# EasyEDA Pro project ProProject_2023新生开发板（小组）_2025-05-30.epro, board PCB2
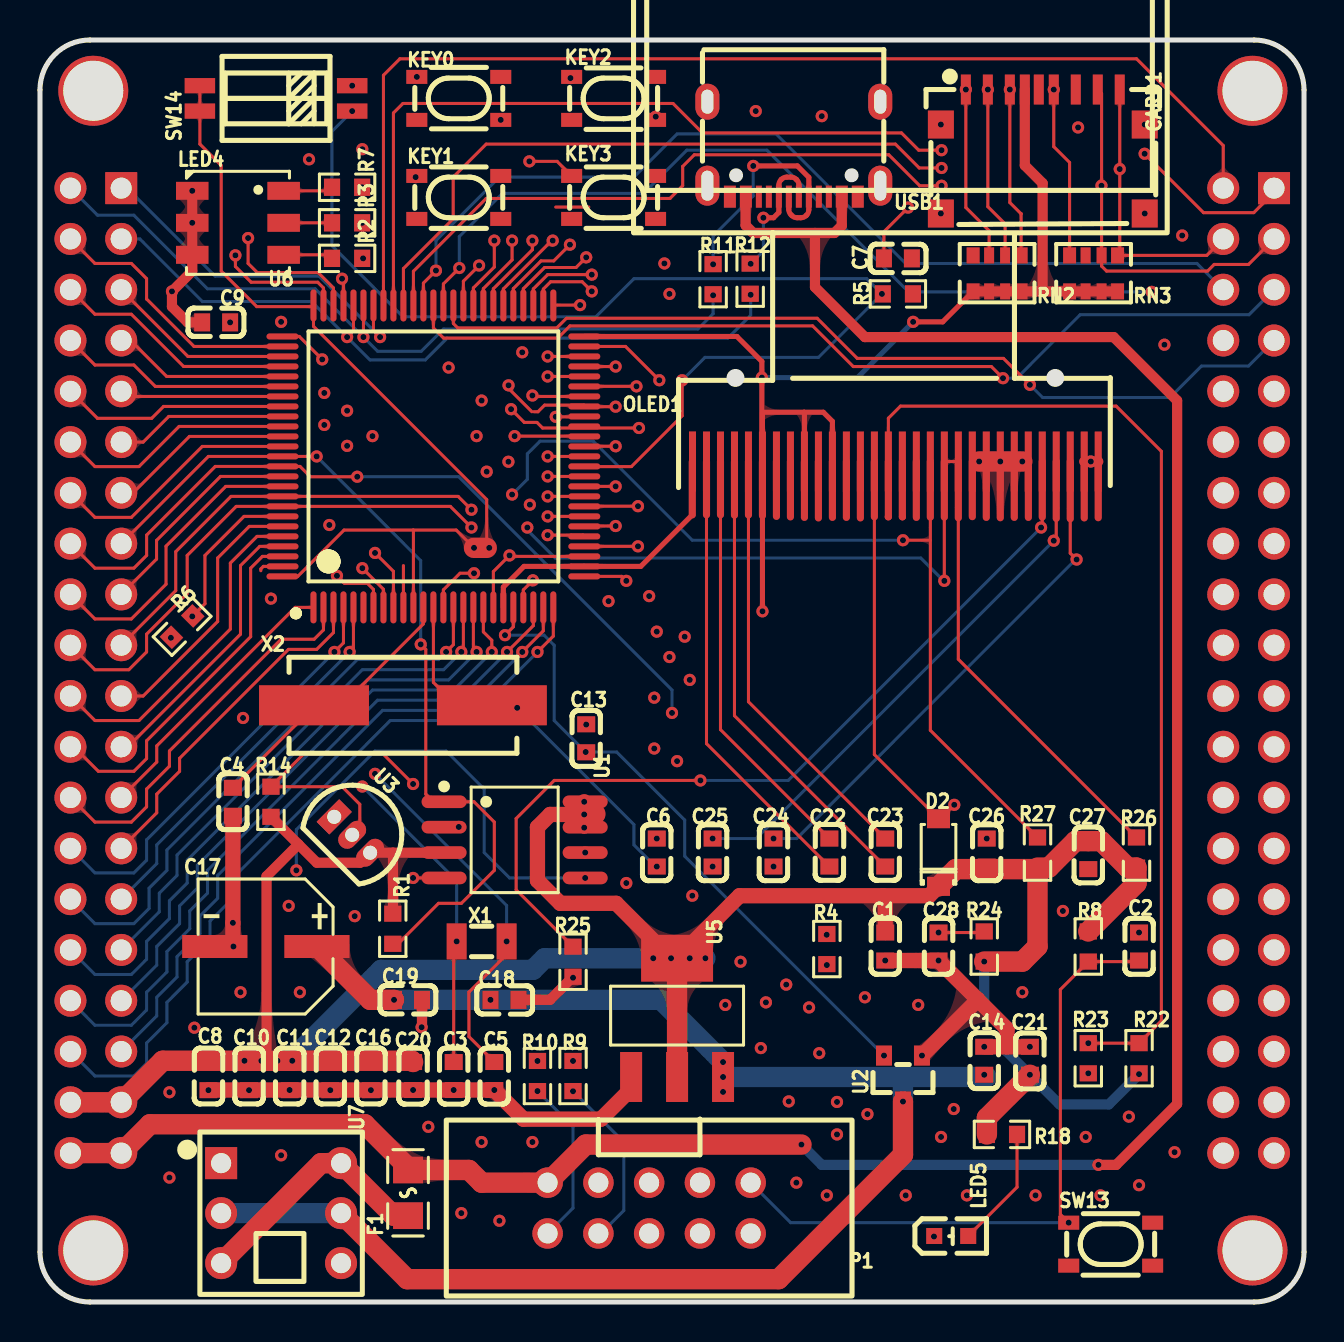
[diagram p4: board, top side]
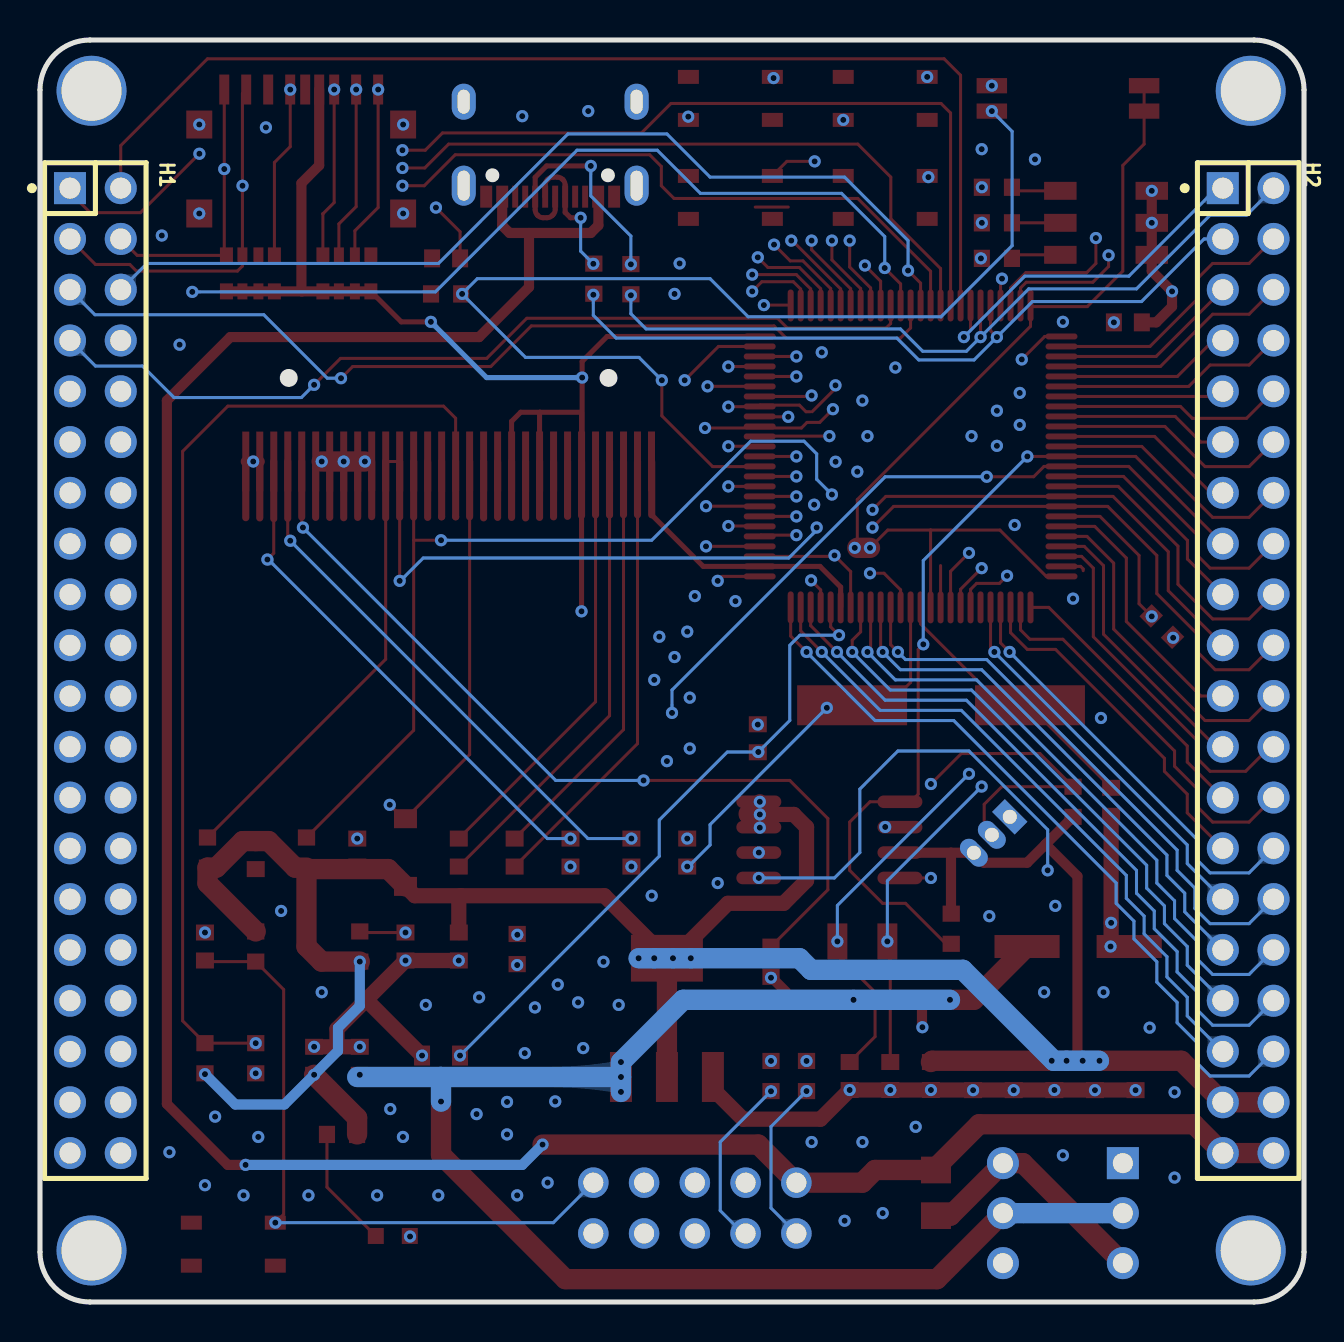
[diagram p5: board, bottom side, seen from below]

Outline 63.25 x 63.12 mm; copper layers: Top Layer, Inner1, Inner2, Bottom Layer. Coordinates in mm from the lower left corner of the outline.
Outline path: 0,60.62 0,2.5 arc(0.73,0.73) 2.5,0 60.75,0 arc(62.51,0.73) 63.25,2.5 63.25,60.62 arc(62.51,62.39) 60.75,63.12 2.5,63.12 arc(0.73,62.39) 0,60.62
Stack: Top Layer 0.035mm 外层铜厚1oz / Dielectric1 0.2104mm 7628 RC49% 8.6mil / Inner1 0.0152mm 内层铜厚 / Dielectric2 1.065mm 1.1mm H/HOZ 含铜 / Inner2 0.0152mm 内层铜厚 / Dielectric3 0.2104mm 7628 RC49% 8.6mil / Bottom Layer 0.035mm 外层铜厚1oz

## Design rules (mm)
template: JLCPCB Capability(Two Layers Board)
spacing copperThickness1oz (default): track to track 0.102, other pairs 0.152 to 0.3
spacing copperThickness2oz: track to track 0.203, other pairs 0.152 to 0.3
track width copperThickness1oz (default): min 0.127, default 0.254, max 2.54
track width copperThickness2oz: min 0.203, default 0.254, max 2.54
differential pair differentialPair (default): width min 0.127, default 0.254, max 2.54; gap min 0.152, default 0.152
via viaSize (default): diameter min 0.5, default 0.61, max 10; hole min 0.3, default 0.305, max 6.3

## Placement (name value [footprint] x y rotation side)
C1  100nF  [C0603]  42.29 17.78 270 top
C2  100nF  [C0603]  54.99 17.78 270 top
C3  12pF  [C0603]  20.7 11.3 90 top
C4  20pF  [C0603]  9.65 25.02 270 top
C5  12pF  [C0603]  22.73 11.3 90 top
C6  20pF  [C0603]  30.86 22.48 90 top
C7  1uF  [C0603]  42.93 52.2 180 top
C8  100nF  [C0603]  8.43 11.3 270 top
C9  1uF  [C0603]  8.81 49 0 top
C10  100nF  [C0603]  10.46 11.3 270 top
C11  100nF  [C0603]  12.49 11.3 270 top
C12  100nF  [C0603]  14.53 11.3 270 top
C13  100nF  [C0603]  27.33 28.19 90 top
C14  1uF  [C0603]  47.24 12.06 270 top
C16  100nF  [C0603]  16.56 11.3 270 top
C17  220uF  [CAP-SMD_BD6.3-L6.6-W6.6-LS7.2-R-RD]  11.3 17.78 0 top
C18  1uF  [C0603]  23.24 15.11 180 top
C19  100nF  [C0603]  18.41 15.11 0 top
C20  1uF  [C0603]  18.67 11.3 90 top
C21  100nF  [C0603]  49.53 12.06 90 top
C22  1uF  [C0603]  39.5 22.48 270 top
C23  1uF  [C0603]  42.29 22.48 270 top
C24  2.2uF  [C0603]  36.7 22.48 90 top
C25  4.7uF  [C0603]  33.66 22.48 90 top
C26  1uF  [C0603]  47.37 22.48 90 top
C27  1uF  [C0603]  52.45 22.35 270 top
C28  4.7uF  [C0603]  44.96 17.78 270 top
CARD1  XKTF-0803-0  [TF-SMD_XKTF-0803-0]  50.18 57.54 180 top
D2  1N4148W  [SOD-123_L2.8-W1.8-LS3.7-RD]  44.96 22.48 90 top
F1  BSMD0805-020-30V  [F0805]  18.41 5.46 90 top
H1  X6521WV-2x20H-C60D30  [HDR-TH_40P-2.54-V-M-R2-C20-S2.54]  60.47 31.58 270 bottom
H2  X6521WV-2x20H-C60D30  [HDR-TH_40P-2.54-V-M-R2-C20-S2.54]  2.79 31.58 270 bottom
KEY0  SKRPACE010  [KEY-SMD_4P-L4.2-W3.2-P2.20-LS4.6]  20.96 60.2 180 top
KEY1  SKRPACE010  [KEY-SMD_4P-L4.2-W3.2-P2.20-LS4.6]  20.96 55.25 0 top
KEY2  SKRPACE010  [KEY-SMD_4P-L4.2-W3.2-P2.20-LS4.6]  28.7 60.2 0 top
KEY3  SKRPACE010  [KEY-SMD_4P-L4.2-W3.2-P2.20-LS4.6]  28.7 55.25 0 top
LED4  MHP5050RGBDT  [LED-ARRAY-SMD_6P-L5.0-W5.0-TR-RD]  9.91 53.98 0 top
LED5  NCD0603R3  [LED0603-R-RD_RED]  45.59 3.3 0 top
NOREF  -  [Pad_e166]  2.67 2.58 0 top
NOREF#2  -  [Pad_e168]  60.67 2.58 0 top
NOREF#3  -  [Pad_e167]  60.67 60.58 0 top
NOREF#4  -  [Pad_e164]  2.67 60.58 0 top
OLED1  N096-2864KSWEG01-H30  [OLED_0.96-30P-P0.70-12864]  42.8 42.04 0 top
P1  2.54-2*5P简牛  [IDC-TH_10P-P2.54_C5665]  30.48 4.7 180 top
R1  10kΩ  [R0603]  17.65 18.67 270 top
R2  220Ω  [R0603]  15.37 52.2 180 top
R3  220Ω  [R0603]  15.37 53.98 180 top
R4  20Ω  [R0603]  39.37 17.65 90 top
R5  10kΩ  [R0603]  42.93 50.42 0 top
R6  10kΩ  [R0603]  7.11 33.78 225 top
R7  470Ω  [R0603]  15.37 55.75 180 top
R8  10kΩ  [R0603]  52.45 17.78 270 top
R9  20Ω  [R0603]  26.67 11.3 90 top
R10  20Ω  [R0603]  24.89 11.3 270 top
R11  20Ω  [R0603]  33.68 51.16 90 top
R12  20Ω  [R0603]  35.53 51.18 90 top
R14  10K  [R0603]  11.56 25.02 270 top
R18  470Ω  [R0603]  48.13 8.38 0 top
R22  4.7K  [R0603]  54.99 12.19 270 top
R23  4.7K  [R0603]  52.45 12.19 90 top
R24  4.7K  [R0603]  47.24 17.78 270 top
R25  910K  [R0603]  26.67 17.02 90 top
R26  4.7K  [R0603]  54.86 22.48 90 top
R27  4.7K  [R0603]  49.91 22.48 90 top
RN2  10kΩ  [RES-ARRAY-SMD_0603-8P-L3.2-W1.6-BL]  47.89 51.45 0 top
RN3  10kΩ  [RES-ARRAY-SMD_0603-8P-L3.2-W1.6-BL]  52.72 51.45 0 top
SW13  SKRPACE010  [KEY-SMD_4P-L4.2-W3.2-P2.20-LS4.6]  53.57 2.89 0 top
SW14  DSHP02TSGET  [SW-SMD_4P_DSHP02TSGET]  11.81 60.2 90 top
U1  W25Q16JVSSIQ  [SOIC-8_L5.3-W5.3-P1.27-LS8.0-BL]  23.75 23.11 270 top
U2  PJ75AL33SA  [SOT-23_L2.9-W1.3-P1.90-LS2.4-BR]  43.18 11.18 90 top
U3  DS18B20  [TO-92-3_L4.9-W3.7-P1.27-L]  15.62 23.37 315 top
U5  AMS1117-3.3  [SOT-223-3_L6.5-W3.4-P2.30-LS7.0-BR]  31.88 14.22 270 top
U6  STM32F407VET6  [LQFP-100_L14.0-W14.0-P0.50-LS16.0-BL]  19.69 42.29 0 top
U7  PB-22E08  [SW-TH_6P-L8.0-W8.0-P2.50_PB-22E08]  12.06 4.45 270 top
USB1  TYPE-C 16PIN 2MD(073)  [USB-C-SMD_TYPE-C-6PIN-2MD-073]  37.72 57.66 180 top
X1  32.768kHz  [FC-135R_L3.2-W1.5]  22.1 18.03 180 top
X2  8MHz  [CRYSTAL-SMD_L11.5-W4.8-LS12.7]  18.16 29.85 0 top

## Footprints (pads in the part's own frame, mm; a bottom-side part is the same pattern mirrored in y, then rotated)
C0603
  rect 0.8x0.9 smd: 1(-0.7,0) 2(0.7,0)
CAP-SMD_BD6.3-L6.6-W6.6-LS7.2-R-RD
  rect 3.26x1.15 smd: 1(2.555,0) 2(-2.555,0)
CRYSTAL-SMD_L11.5-W4.8-LS12.7
  rect 5.5x2 smd: 1(-4.45,0) 2(4.45,0)
F0805
  rect 1.335x1.5 smd: 1(-1.143,0) 2(1.143,0)
FC-135R_L3.2-W1.5
  rect 1x1.8 smd: 1(-1.25,0) 2(1.25,0)
HDR-TH_40P-2.54-V-M-R2-C20-S2.54
  rect 1.6x1.6 hole 1.05: 1(-24.13,-1.27)
  round 1.6 hole 1.05: 2(-24.13,1.27) 3(-21.59,-1.27) 4(-21.59,1.27) 5(-19.05,-1.27) 6(-19.05,1.27) 7(-16.51,-1.27) 8(-16.51,1.27) 9(-13.97,-1.27) 10(-13.97,1.27) 11(-11.43,-1.27) 12(-11.43,1.27) 13(-8.89,-1.27) 14(-8.89,1.27) 15(-6.35,-1.27) 16(-6.35,1.27) 17(-3.81,-1.27) 18(-3.81,1.27) 19(-1.27,-1.27) 20(-1.27,1.27) 21(1.27,-1.27) 22(1.27,1.27) 23(3.81,-1.27) 24(3.81,1.27) 25(6.35,-1.27) 26(6.35,1.27) 27(8.89,-1.27) 28(8.89,1.27) 29(11.43,-1.27) 30(11.43,1.27) 31(13.97,-1.27) 32(13.97,1.27) 33(16.51,-1.27) 34(16.51,1.27) 35(19.05,-1.27) 36(19.05,1.27) 37(21.59,-1.27) 38(21.59,1.27) 39(24.13,-1.27) 40(24.13,1.27)
IDC-TH_10P-P2.54_C5665
  round 1.524 hole 1: 1(-5.08,-1.27) 2(-5.08,1.27) 3(-2.54,-1.27) 4(-2.54,1.27) 5(0,-1.27) 6(0,1.27) 7(2.54,-1.27) 8(2.54,1.27) 9(5.08,-1.27) 10(5.08,1.27)
KEY-SMD_4P-L4.2-W3.2-P2.20-LS4.6
  rect 1.05x0.7 smd: 1(-2.1,1.075) 2(2.1,1.075) 3(-2.1,-1.075) 4(2.1,-1.075)
LED0603-R-RD_RED
  rect 0.8x0.8 smd: 1(0.851,0) 2(-0.851,0)
LED-ARRAY-SMD_6P-L5.0-W5.0-TR-RD
  rect 1.625x0.896 smd: 1(2.288,1.6) 2(-2.288,1.6) 3(2.288,0) 4(-2.288,0) 5(2.288,-1.6) 6(-2.288,-1.6)
LQFP-100_L14.0-W14.0-P0.50-LS16.0-BL
  oval 0.3x1.6 smd: 1(-6,-7.55) 2(-5.5,-7.55) 3(-5,-7.55) 4(-4.5,-7.55) 5(-4,-7.55) 6(-3.5,-7.55) 7(-3,-7.55) 8(-2.5,-7.55) 9(-2,-7.55) 10(-1.5,-7.55) 11(-1,-7.55) 12(-0.5,-7.55) 13(0,-7.55) 14(0.5,-7.55) 15(1,-7.55) 16(1.5,-7.55) 17(2,-7.55) 18(2.5,-7.55) 19(3,-7.55) 20(3.5,-7.55) 21(4,-7.55) 22(4.5,-7.55) 23(5,-7.55) 24(5.5,-7.55) 25(6,-7.55) 51(6,7.55) 52(5.5,7.55) 53(5,7.55) 54(4.5,7.55) 55(4,7.55) 56(3.5,7.55) 57(3,7.55) 58(2.5,7.55) 59(2,7.55) 60(1.5,7.55) 61(1,7.55) 62(0.5,7.55) 63(0,7.55) 64(-0.5,7.55) 65(-1,7.55) 66(-1.5,7.55) 67(-2,7.55) 68(-2.5,7.55) 69(-3,7.55) 70(-3.5,7.55) 71(-4,7.55) 72(-4.5,7.55) 73(-5,7.55) 74(-5.5,7.55) 75(-6,7.55)
  oval 1.6x0.3 smd: 26(7.55,-6) 27(7.55,-5.5) 28(7.55,-5) 29(7.55,-4.5) 30(7.55,-4) 31(7.55,-3.5) 32(7.55,-3) 33(7.55,-2.5) 34(7.55,-2) 35(7.55,-1.5) 36(7.55,-1) 37(7.55,-0.5) 38(7.55,0) 39(7.55,0.5) 40(7.55,1) 41(7.55,1.5) 42(7.55,2) 43(7.55,2.5) 44(7.55,3) 45(7.55,3.5) 46(7.55,4) 47(7.55,4.5) 48(7.55,5) 49(7.55,5.5) 50(7.55,6) 76(-7.55,6) 77(-7.55,5.5) 78(-7.55,5) 79(-7.55,4.5) 80(-7.55,4) 81(-7.55,3.5) 82(-7.55,3) 83(-7.55,2.5) 84(-7.55,2) 85(-7.55,1.5) 86(-7.55,1) 87(-7.55,0.5) 88(-7.55,0) 89(-7.55,-0.5) 90(-7.55,-1) 91(-7.55,-1.5) 92(-7.55,-2) 93(-7.55,-2.5) 94(-7.55,-3) 95(-7.55,-3.5) 96(-7.55,-4) 97(-7.55,-4.5) 98(-7.55,-5) 99(-7.55,-5.5) 100(-7.55,-6)
OLED_0.96-30P-P0.70-12864
  rect 0.35x3 smd: 1(-10.15,0.003) 2(-9.45,0.001) 3(-8.75,0.001) 4(-8.05,0.001) 5(-7.35,0.001) 6(-6.65,0.001) 7(-5.95,0.001) 8(-5.25,0.001) 9(-4.55,0.001) 10(-3.85,0.001) 11(-3.15,0.001) 12(-2.45,0.001) 13(-1.75,0.001) 14(-1.05,0.001) 15(-0.35,0.001) 16(0.35,0.001) 17(1.05,0.001) 18(1.75,0.001) 19(2.45,0.001) 20(3.15,0.001) 21(3.85,0.001) 22(4.55,0.001) 23(5.25,0.001) 24(5.95,0.001) 25(6.65,0.001) 26(7.35,0.001) 27(8.05,0.001) 28(8.75,-0.002) 29(9.45,-0.003) 30(10.15,-0.003)
Pad_e164
  round 3.5 hole 3: NC(0,0)
Pad_e166
  round 3.5 hole 3: NC(0,0)
Pad_e167
  round 3.5 hole 3: NC(0,0)
Pad_e168
  round 3.5 hole 3: NC(0,0)
R0603
  rect 0.806x0.864 smd: 1(-0.753,0) 2(0.753,0)
RES-ARRAY-SMD_0603-8P-L3.2-W1.6-BL
  rect 0.65x0.8 smd: 1(-1.2,-0.9) 4(1.2,-0.9) 5(1.2,0.9) 8(-1.2,0.9)
  rect 0.5x0.8 smd: 2(-0.4,-0.9) 3(0.4,-0.9) 6(0.4,0.9) 7(-0.4,0.9)
SOD-123_L2.8-W1.8-LS3.7-RD
  rect 0.95x1.15 smd: 1(-1.692,0) 2(1.692,0)
SOIC-8_L5.3-W5.3-P1.27-LS8.0-BL
  oval 0.63x2.25 smd: 1(-1.905,-3.53) 2(-0.635,-3.53) 3(0.635,-3.53) 4(1.905,-3.53) 5(1.905,3.53) 6(0.635,3.53) 7(-0.635,3.53) 8(-1.905,3.53)
SOT-23_L2.9-W1.3-P1.90-LS2.4-BR
  rect 1x0.8 smd: 1(1.15,-0.95) 2(1.15,0.95) 3(-1.15,0)
SOT-223-3_L6.5-W3.4-P2.30-LS7.0-BR
  rect 2.5x1.1 smd: 1(2.97,-2.3) 2(2.97,0) 3(2.97,2.3)
  rect 2.34x3.6 smd: 4(-2.97,0)
SW-SMD_4P_DSHP02TSGET
  rect 0.762x1.524 smd: 1(-0.635,-3.81) 2(0.635,-3.81) 3(0.635,3.81) 4(-0.635,3.81)
SW-TH_6P-L8.0-W8.0-P2.50_PB-22E08
  rect 1.6x1.6 hole 1: 1(-2.5,-3)
  round 1.6 hole 1: 2(0,-3) 3(2.5,-3) 4(-2.5,3) 5(0,3) 6(2.5,3)
TF-SMD_XKTF-0803-0
  rect 0.5x1.5 smd: 1(3.85,-3.1) 2(2.75,-3.1) 3(1.65,-3.1) 4(0.9,-3.1) 5(-0.55,-3.1) 6(-1.65,-3.1) 7(-2.75,-3.1) 8(-3.85,-3.1) 9(0.2,-3.1)
  rect 1.3x1.4 smd: 10(-5.1,-1.35) 11(-5.1,3.1) 12(5.1,3.1) 13(5.1,-1.35)
TO-92-3_L4.9-W3.7-P1.27-L
  rect 0.9x1.6 hole 0.7: 1(-1.27,0)
  oval 0.9x1.6 hole 0.7: 2(0,0) 3(1.27,0)
USB-C-SMD_TYPE-C-6PIN-2MD-073
  rect 0.6x1.1 smd: 1(-3.2,2.375) 2(-2.4,2.375) 11(2.4,2.375) 12(3.2,2.375)
  rect 0.3x1.1 smd: 3(-1.75,2.375) 4(-1.25,2.375) 5(-0.75,2.375) 6(-0.25,2.375) 7(0.25,2.375) 8(0.75,2.375) 9(1.25,2.375) 10(1.75,2.375)
  oval 1.2x2 hole 0.6x1.5: 13(-4.325,1.825) 14(4.325,1.825)
  oval 1.2x1.8 hole 0.6x1.2: 13(-4.325,-2.375) 14(4.325,-2.375)

## Nets
As in the schematic, except:
GND: C1.2 C2.1 C3.1 C4.2 C5.1 C6.2 C7.1 C8.2 C9.1 C10.2 C11.2 C12.2 C13.2 C14.1 C16.2 C17.2 C18.1 C19.2 C20.1 C21.2 C24.1 C25.1 C26.2 C27.2 C28.2 CARD1.6 CARD1.10 CARD1.11 CARD1.12 CARD1.13 H1.39 H1.40 KEY0.4 KEY1.4 KEY2.4 KEY3.4 LED4.2 LED4.4 LED4.6 LED5.2 OLED1.1 OLED1.8 OLED1.10 OLED1.12 OLED1.13 OLED1.16 OLED1.17 OLED1.21 OLED1.22 OLED1.23 OLED1.24 OLED1.25 OLED1.29 OLED1.30 P1.5 P1.6 R5.2 R6.2 R23.1 R25.1 SW13.4 U1.4 U2.1 U3.1 U5.1 U6.10 U6.20 U6.27 U6.74 U6.99 USB1.1 USB1.12 USB1.13 USB1.14
KEY0: H2.30 KEY0.1 U6.15
KEY1: H2.31 KEY1.1 U6.16
KEY2: H2.32 KEY2.1 U6.17
KEY3: H2.33 KEY3.1 U6.18

Pads without a net: CARD1 9; KEY0 2 3; KEY1 2 3; KEY2 2 3; KEY3 2 3; NOREF NC; NOREF#2 NC; NOREF#3 NC; NOREF#4 NC; OLED1 7; P1 3 7; RN2 8; RN3 7; SW13 2 3; U7 1 6; USB1 3 4 9 10

## Via types
v1: diameter 0.61, hole 0.305, Top Layer to Bottom Layer, 274 vias

## Routing (per net, layer and track width the routed paths; a pad name or vN(x,y) marks a point on that pad's centre or on a via; arc(x,y) is an arc through that point)
3V3: length 294.5
  Top Layer w0.152: v1(24.66,36.09) 24.19,35.62 U6.22 ; U6.100 12.9,36.29 15.21,38.61 18.67,38.61 18.69,38.58 ; v1(23.49,37.34) 23.54,37.29 U6.28 ; 22.35,37.9 22.35,40.13 13.69,48.8 U6.75 13.63,49.78 10.85,49.78 9.07,51.56 9.07,56.85 8,57.91 SW14.4 SW14.3 ; 18.69,38.58 18.69,38.57 U6.11 ; 18.69,38.58 18.69,38.61 20.83,38.61 v1(21.72,37.72) ; 23.36,37.21 22.69,36.53 U6.19
  Top Layer w0.254: 38.24,44.5 38.25,44.49 OLED1.9 ; 38.24,44.5 39.19,44.5 39.65,44.04 39.65,42.04 ; 38.24,44.5 36.15,44.5 OLED1.6 36.12,42.07 v1(36.12,46.23) 36.12,47.04 34.87,48.29 U6.50 ; 36.15,39.33 v1(36.15,34.54) ; RN2.1 45.17,49.02 v1(43.69,49.02)
  Top Layer w0.355: OLED1.6 36.15,39.33 ; OLED1.9 38.25,39.24 ; 39.65,42.04 39.65,39.24
  Top Layer w0.508: 12.93,22.89 11.34,21.3 11.34,12.06 ; 12.93,22.89 R14.2 ; 12.93,22.89 13.85,21.97 16.02,21.97 16.52,22.47 17.66,22.47 ; 17.66,22.47 17.66,19.43 R1.1 ; 17.66,22.47 19.29,22.47 19.3,22.48 U1.3 ; 50.14,50.55 50.16,50.57 50.16,55.96 49.28,56.85 CARD1.4 ; 50.14,50.55 RN3.2 RN3.3 RN3.4 ; 50.14,50.55 RN2.4 RN2.3 RN2.2 RN2.1
  Top Layer w0.762: C1.1 42.29,20.22 42.19,20.32 ; v1(27.23,25.02) v1(27.23,24.38) 25.53,24.38 24.89,23.75 24.89,21.08 26.03,19.94 28.83,19.94 v1(31.57,17.19) U5.4 35,20.32 42.19,20.32 ; D2.1 44.49,20.32 42.19,20.32
  Top Layer w1.016: 27.79,24.41 27.76,24.38 v1(27.23,24.38) ; C20.2 18.61,12.06 v1(12.62,12.06) v1(11.88,12.06) v1(10.23,12.06) 6.14,12.06 H2.37 H2.38 ; D2.1 45.82,21.65 49.91,21.65 49.91,17.78 49.16,17.03 v1(47.24,17.03) ; v1(49.53,11.37) 47.38,9.21 R18.1 ; R27.1 50.48,21.73 51.81,23.05 C27.1 53.1,23.05 54.42,21.73 R26.1 54.86,20.95 R8.1 ; 31.88,11.25 U5.4 ; 22.35,37.72 v1(21.72,37.72)
  Inner1 w0.254: v1(36.15,34.54) 30.27,34.54 28.28,32.55
  Inner1 w1.016: v1(27.23,23.72) v1(27.23,24.38) 27.23,25.2 29.46,27.43 29.46,31.37 v1(23.49,37.34) 23.11,37.72 v1(22.48,37.72) v1(21.72,37.72)
  Bottom Layer w0.254: v1(36.12,46.23) 40.9,46.23 v1(43.69,49.02)
  Bottom Layer w0.508: v1(47.24,17.03) 47.24,14.81 48.34,13.72 48.34,12.56 v1(49.53,11.37) 51.01,9.88 53.47,9.88 v1(54.99,11.4)
  Bottom Layer w1.016: v1(33.29,17.19) v1(32.51,17.19) v1(31.57,17.19) v1(30.68,17.19) 25.25,17.19 24.66,16.61 17.07,16.61 12.52,12.06 v1(11.88,12.06) v1(11.08,12.06) 10.26,12.06
+5V: length 79.4
  Top Layer w1.016: C17.1 16.53,15.11 v1(17.72,15.11) ; v1(43.18,10.03) 43.18,7.37 36.96,1.14 18.37,1.14 U7.5
  Bottom Layer w1.016: v1(17.72,15.11) v1(22.54,15.11) 31.06,15.11 v1(34.18,12) v1(34.18,11.25) ; v1(34.18,11.25) 43.19,11.25 ; v1(34.18,11.25) v1(34.18,10.51) ; 43.19,11.25 47.37,11.25 ; 43.19,11.25 43.18,11.24 v1(43.18,10.03) ; U7.2 U7.5
  vias: v1(47.24,11.37)
GND: length 128
  Top Layer w0.152: U1.4 v1(18.67,21.21) ; U6.74 14.19,50.72 13.9,51 10.57,51 9.78,51.79 v1(9.78,52.35) ; 11.05,36.58 11.05,36.66 11.18,36.79 U6.99 ; U6.10 18.19,36.83 ; 25.81,54.76 27.46,54.76
  Top Layer w0.254: U6.20 23.19,35.76 24.22,36.79 U6.27 30.06,36.79 32.64,39.37 ; 32.64,42.03 OLED1.1
  Top Layer w0.355: v1(48.05,42.04) 48.05,39.23 ; 32.64,42.03 32.64,39.37 ; OLED1.22 47.35,39.24 ; v1(49.15,42.04) 49.45,41.73 49.45,39.24 ; OLED1.21 46.65,39.28 ; OLED1.8 37.55,39.27 ; OLED1.29 52.25,39.22 ; OLED1.17 43.85,39.24 ; OLED1.24 48.75,39.24 ; 43.15,39.27 43.15,39.27 OLED1.16 ; OLED1.10 38.95,39.22 ; OLED1.13 41.05,39.22 ; OLED1.30 52.95,39.23 ; OLED1.12 40.35,39.24
  Top Layer w0.508: v1(19.1,13.74) 19.12,13.76 C19.2 ; R25.1 25.52,15.11 C18.1 ; OLED1.29 OLED1.30 ; v1(7.62,55.58) v1(7.62,53.98) LED4.6 7.62,51.56 v1(6.6,50.55) 6.6,49.78 7.39,49 C9.1
  Top Layer w0.762: v1(47.24,12.77) 48.39,12.77 ; 48.39,12.77 48.39,13.65 46.9,15.13 ; 48.39,12.77 v1(49.53,12.77) ; 46.9,15.13 v1(44.96,17.08) v1(42.29,17.08) ; 46.9,15.13 46.9,15.1 v1(44.13,12.33) ; v1(8.43,10.6) 8.44,10.6 v1(12.49,10.6) v1(18.67,10.6) v1(20.7,10.6) v1(22.73,10.6) 24.19,9.14 28.07,9.14 29.58,10.65 29.58,11.25 ; C17.2 9.65,17.78 v1(9.65,18.97) C4.2
  Top Layer w1.016: v1(46.99,42.04) OLED1.22 v1(48.05,42.04) OLED1.24 v1(49.15,42.04)
  Inner2 w1.524: 32.51,59.77 33.13,59.77 USB1.14 34.63,60.03 34.7,60.1 ; 32.23,55.8 32.26,55.83 USB1.14
  vias: v1(6.48,10.49) v1(6.48,6.22) v1(6.55,33.22) v1(7.73,13.72) v1(9.68,17.78) v1(10.03,15.49) v1(10.16,29.21) v1(10.46,10.6) v1(11.56,35.18) v1(12.06,49.02) v1(12.06,7.34) v1(12.45,19.81) v1(13,15.49) v1(13.46,57.15) v1(14.22,45.47) v1(14.22,43.87) v1(14.48,38.86) v1(14.53,10.6) v1(15.37,44.58) v1(15.37,42.82) v1(15.75,19.3) v1(16.13,57.66) v1(16.56,10.6) v1(16.64,43.31) v1(18.85,61.27) v1(19.43,8.76) v1(20.45,46.74) v1(21.08,4.45) v1(21.84,43.31) v1(22.1,45.09) v1(22.09,8) v1(22.35,41.53) v1(22.99,4.06) v1(23.44,42.03) v1(24.13,47.5) v1(24.51,39.88) v1(24.64,8) v1(26.67,16.22) v1(27.33,28.88) v1(28.45,35.05) v1(29.34,20.96) v1(30.48,35.31) v1(30.81,59.28) v1(30.73,30.23) v1(30.73,27.68) v1(30.86,33.53) v1(30.86,23.18) v1(31.24,51.94) v1(31.5,50.42) v1(31.5,32.26) v1(31.88,27.05) v1(32.26,33.27) v1(32.51,31.12) v1(32.64,20.32) v1(33.66,21.78) v1(34.29,14.86) v1(35.05,17.02) v1(35.81,59.56) v1(36.07,12.7) v1(36.32,14.99) v1(36.7,21.78) v1(37.34,15.88) v1(37.47,10.03) v1(37.85,5.97) v1(38.48,14.73) v1(38.99,12.45) v1(39.12,59.31) v1(39.37,5.33) v1(39.88,10.01) v1(39.88,8.38) v1(41.28,15.24) v1(41.4,9.4) v1(43.32,5.33) v1(43.94,14.86) v1(44.73,3.28) v1(45.08,58.89) v1(45.08,54.44) v1(45.09,8.25) v1(45.72,9.65) v1(46.38,5.33) v1(47.37,23.18) v1(49.15,15.49) v1(49.81,5.33) v1(51.18,19.56) v1(51.94,58.75) v1(52.32,8.25) v1(52.45,11.44) v1(52.58,42.04) v1(53.06,5.33) v1(54.48,9.27) v1(54.99,18.48) v1(54.99,5.84) v1(55.28,58.89) v1(55.28,54.44) v1(56.26,47.88) v1(56.77,7.49) v1(57.15,53.34)
VIN: length 126.1
  Top Layer w0.508: USB1.11 35.31,55.27 35.31,53.85 35.69,53.47 38.78,53.47 ; 38.78,53.47 39.75,53.47 40.12,53.84 USB1.2 ; 38.78,53.47 38.78,50.76 41.28,48.26 53.72,48.26 56.9,45.09 56.9,9.91 53.85,6.86 v1(52.96,6.86)
  Top Layer w1.016: H2.40 H2.39 5.5,8.89 16.26,8.89 18.41,6.73 F1.2 21.46,6.6 22.1,5.97 P1.9 27.31,7.87 v1(38.1,7.87)
  Bottom Layer w0.508: v1(52.96,6.86) 39.12,6.86 v1(38.1,7.87)
(no net): length 2.7
  Top Layer w0.355: OLED1.7 36.85,39.29
BOOT0: length 37.8
  Top Layer w0.152: R6.1 8.25,34.93 8.25,37.34 10.21,39.29 U6.94
  Inner2 w0.152: v1(15.62,60.83) 7.62,52.83 v1(7.62,34.29)
BOOT1: length 56.8
  Top Layer w0.152: U6.37 27.24,41.78 29.59,41.78 32.13,44.32 v1(32.13,46.1)
  Bottom Layer w0.152: v1(15.62,59.56) 14.6,58.55 14.6,52.83 18.16,49.28 27.81,49.28 29.72,51.18 41.36,51.18 v1(42.13,50.42) 38.95,47.24 33.27,47.24 v1(32.13,46.1)
DS18B20: length 29.9
  Top Layer w0.152: U6.7 16.69,35.64 16.38,35.94 15.24,35.94 v1(14.86,36.32) ; v1(18.67,25.91) 17.15,27.43 13.22,27.43 R14.1 15.12,25.77 16,24.89 16,23.75 U3.2
  Inner1 w0.152: v1(18.67,25.91) 17.78,26.8 17.78,33.4 v1(14.86,36.32)
FLASH_CS: length 43.8
  Top Layer w0.152: v1(19.05,32.89) 19.3,32.64 19.3,25.4 19.69,25.02 U1.1 21.72,25.02 22.73,24 22.73,21.59 21.08,19.94 19.94,19.94 17.92,17.92 R1.2 ; H2.15 8.43,42.29 U6.88 v1(13.84,42.29)
  Bottom Layer w0.152: v1(19.05,32.89) 19.05,37.08 v1(13.84,42.29)
KEY0: length 60.6
  Top Layer w0.152: v1(20.32,32.51) 20.69,32.88 U6.15
  Inner1 w0.152: v1(23.06,59.12) 18.99,59.12 17.96,58.09 17.96,46.13 19.43,44.65 19.43,33.4 v1(20.32,32.51)
  Bottom Layer w0.152: v1(20.32,32.51) 19.94,32.13 15.88,32.13 6.35,22.61 6.35,21.59 5.46,20.7 5.46,19.69 4.7,18.92 2.75,18.92 H2.30
KEY1: length 51.5
  Top Layer w0.152: v1(21.08,32.51) 21.19,32.62 U6.16
  Inner1 w0.152: v1(18.8,56.26) 18.59,56.06 18.59,46.48 19.96,45.11 19.96,33.63 v1(21.08,32.51)
  Bottom Layer w0.152: H2.31 5.97,19.51 5.97,20.45 6.86,21.34 6.86,22.35 16.13,31.62 20.19,31.62 v1(21.08,32.51)
KEY2: length 64.4
  Top Layer w0.152: v1(21.84,32.51) 21.69,32.67 U6.17
  Inner1 w0.152: v1(26.54,61.21) 26.54,60.83 19.18,53.47 19.18,46.74 20.47,45.44 20.47,33.88 v1(21.84,32.51)
  Bottom Layer w0.152: H2.32 2.75,16.38 4.57,16.38 5.33,17.15 5.33,18.03 6.48,19.18 6.48,20.07 7.37,20.96 7.37,22.1 16.38,31.12 20.45,31.12 v1(21.84,32.51)
KEY3: length 64.3
  Top Layer w0.152: U6.18 22.19,33.52 22.61,33.1 v1(22.61,32.51) ; KEY3.1 25.87,57.05 v1(24.49,57.05)
  Inner1 w0.152: v1(24.49,57.05) 28.57,52.96 28.57,50.17 27.43,49.02 24.26,49.02 20.96,45.72 20.96,34.16 v1(22.61,32.51)
  Bottom Layer w0.152: v1(22.61,32.51) 20.7,30.61 16.64,30.61 7.87,21.84 7.87,20.7 6.98,19.81 6.98,18.92 5.84,17.78 5.84,16.85 H2.33
NRST: length 75.9
  Top Layer w0.152: v1(51.47,3.97) 51.05,4.39 51.05,15.63 R8.2 54.94,17.03 C2.2 ; U6.14 20.19,35.62 21.02,36.45 v1(21.72,36.45)
  Inner1 w0.152: P1.1 33.53,8 27.69,8 25.78,9.91 25.78,33.15 22.48,36.45 v1(21.72,36.45)
  Bottom Layer w0.152: v1(51.47,3.97) 37.56,3.97 P1.1
PA0: length 35.2
  Top Layer w0.152: U6.23 24.69,33.83 v1(23.37,32.51)
  Bottom Layer w0.152: H2.34 2.75,13.84 4.57,13.84 5.33,14.61 5.33,15.49 6.35,16.51 6.35,17.53 7.49,18.67 7.49,19.56 8.38,20.45 8.38,21.59 16.89,30.1 20.96,30.1 v1(23.37,32.51)
PA1: length 33.3
  Top Layer w0.152: U6.24 25.19,33.57 v1(24.13,32.51)
  Bottom Layer w0.152: v1(24.13,32.51) 21.21,29.59 17.15,29.59 8.89,21.34 8.89,20.19 8,19.3 8,18.42 6.86,17.27 6.86,16.26 5.84,15.24 5.84,14.31 H2.35
PA2: length 38.1
  Top Layer w0.152: v1(24.89,32.51) 25.69,33.31 U6.25
  Bottom Layer w0.152: v1(24.89,32.51) 21.46,29.08 17.53,29.08 9.4,20.96 9.4,19.94 8.51,19.05 8.51,18.16 7.37,17.02 7.37,16 6.35,14.99 6.35,13.97 5.33,12.95 5.33,11.94 4.7,11.3 2.75,11.3 H2.36
PA3: length 46.4
  Top Layer w0.152: U6.26 29.11,36.29 v1(29.34,36.07)
  Inner2 w0.152: v1(29.34,36.07) 31.11,36.07 58.41,8.76 60.52,8.76 H1.37
PA4: length 43.5
  Top Layer w0.152: U6.29 27.24,37.8 v1(29.92,37.8)
  Inner2 w0.152: H1.38 58.46,9.99 30.66,37.8 v1(29.92,37.8)
PA5: length 50.2
  Top Layer w0.152: v1(25.4,38.35) 27.17,38.35 U6.30
  Inner2 w0.152: v1(25.4,38.35) 25.84,37.91 29.07,37.91 29.49,38.33 31.22,38.33 58.13,11.42 60.64,11.42 H1.35
PA6: length 42.9
  Top Layer w0.152: U6.31 27.25,38.81 v1(28.8,38.81)
  Inner2 w0.152: v1(28.8,38.81) 32.92,38.81 H1.36
PA7: length 49.4
  Top Layer w0.152: U6.32 v1(25.4,39.29)
  Inner2 w0.152: H1.33 61.75,14.98 60.58,13.82 58.65,13.82 33.2,39.27 29.46,39.27 29.31,39.42 25.53,39.42 v1(25.4,39.29)
PA8: length 56.8
  Top Layer w0.152: H1.1 61.75,55.5 60.73,54.48 58.22,54.48 v1(55.27,57.43) ; v1(45.11,57.61) 43.97,57.61 43.1,58.47 33.15,58.47 31.67,59.94 18.16,59.94 17.69,59.47 U6.67
  Inner2 w0.152: v1(45.11,57.61) 55.09,57.61 v1(55.27,57.43)
PA9: length 131.6
  Top Layer w0.152: U6.68 17.19,61.36 18.01,62.18 54.86,62.18 59.21,57.84 H1.2
  Inner1 w0.152: H1.2 57.96,54.47 57.96,14.97 56.83,13.84 28.46,13.84 v1(26.67,12.06)
PA10: length 57.2
  Top Layer w0.152: v1(17.02,48.26) 16.69,48.59 U6.69
  Inner1 w0.152: v1(24.89,12.06) 24.89,21.08 18.41,27.56 18.41,44.58 17.02,45.97 v1(17.02,48.26)
  Bottom Layer w0.152: v1(17.02,48.26) 13.97,51.31 8.76,51.31 4.36,55.71 H2.1
PA11: length 38.8
  Top Layer w0.152: U6.70 v1(16.19,48.26)
  Bottom Layer w0.152: 33.68,50.34 33.68,49.43 32.92,48.67 20.19,48.67 19.08,47.55 16.9,47.55 v1(16.19,48.26) 13.77,50.67 8.38,50.67 4.7,54.36 2.88,54.36 H2.2
  vias: v1(33.68,50.35)
PA12: length 37.7
  Top Layer w0.152: U6.71 15.69,48.58 v1(15.37,48.26)
  Bottom Layer w0.152: v1(35.56,50.38) 35.56,49.35 34.42,48.21 20.37,48.21 19.28,47.12 16.51,47.12 v1(15.37,48.26) 13.59,50.04 8.13,50.04 5,53.17 H2.3
PA13: length 57.9
  Top Layer w0.152: U6.72 15.19,51.11 v1(15.11,51.18)
  Inner2 w0.152: v1(15.11,51.18) 14.73,50.8 14.73,47.63 18.03,44.32 18.03,24.51 24.51,18.03 24.51,17.02 34.29,7.24 34.29,4.7 P1.4
PA14: length 58.6
  Top Layer w0.152: U6.76 12.97,48.29 v1(14.12,47.14)
  Inner2 w0.152: P1.2 34.29,2.16 32.51,2.16 31.75,2.92 31.75,8.38 22.1,18.03 22.1,19.18 17.4,23.88 17.4,43.87 v1(14.12,47.14)
PA15: length 13.4
  Top Layer w0.152: H2.4 2.75,51.94 4.57,51.94 5.33,51.18 5.33,50.17 7.71,47.79 U6.77
PB0: length 41.7
  Top Layer w0.152: U6.35 28.96,40.79
  Inner2 w0.152: v1(28.8,40.79) 34.98,40.79 58.16,17.61 H1.32
PB1: length 48.2
  Top Layer w0.152: U6.36 v1(25.4,41.29)
  Inner2 w0.152: H1.29 60.49,18.9 57.61,18.9 35,41.5 25.61,41.5 v1(25.4,41.29)
PB3: length 54.2
  Top Layer w0.152: H2.16 2.75,36.7 4.7,36.7 5.34,37.34 5.34,38.36 8.77,41.79 U6.89 13.01,41.79 13.53,41.28 v1(15.88,41.28)
  Inner1 w0.152: v1(39.36,18.37) 38.02,18.37 35.18,21.21 35.18,25.15 31.62,28.7 v1(31.62,29.46)
  Bottom Layer w0.152: v1(31.62,29.46) 31.62,30.61 20.96,41.28 v1(15.88,41.28)
PB4: length 33.5
  Top Layer w0.152: H2.17 5.83,37.16 5.83,38.09 9.03,41.29 U6.90
  Inner1 w0.152: H2.17 5.33,34.12 5.33,32.89 12.57,25.65 15.37,25.65 17.26,23.76 v1(20.96,23.76)
PB5: length 56.8
  Top Layer w0.152: U6.91 9.3,40.79 6.31,37.8 6.31,35.9 4.57,34.16 2.75,34.16 H2.18
  Inner1 w0.152: H2.18 2.79,34.12 2.79,32.26 3.43,31.62 4.7,31.62 12.83,23.5 v1(12.83,21.59)
  Bottom Layer w0.152: v1(12.83,21.59) 12.83,23.62 16.76,27.56 20.32,27.56 22.22,25.65 22.22,22.48 23.5,21.21 v1(27.28,21.21)
PB6: length 70.2
  Top Layer w0.152: H2.19 6.79,35.58 6.79,37.53 9.56,40.29 U6.92 20.92,40.29 v1(21.59,39.62) ; R27.2 44.55,28.59 44.55,38.1 ; 44.55,38.1 v1(43.18,38.1) ; 44.55,38.1 44.55,39.26
  Top Layer w0.355: OLED1.18 44.55,39.26
  Inner2 w0.152: v1(21.59,39.62) 22.86,39.62 v1(23.62,40.39)
  Bottom Layer w0.152: v1(43.18,38.1) 32.64,38.1 27.69,43.05 25.02,43.05 24.38,42.42 24.38,41.15 v1(23.62,40.39)
PB7: length 80
  Top Layer w0.152: 45.25,39.26 v1(45.25,36.07) ; H2.20 2.75,31.62 4.45,31.62 5.33,32.51 5.33,33.4 7.37,35.43 7.37,37.34 9.82,39.79 U6.93 20.53,39.79 v1(21.59,38.74) ; 45.95,39.22 45.95,32.15 R26.2 ; OLED1.20 OLED1.19
  Top Layer w0.355: OLED1.20 45.95,39.22 ; OLED1.19 45.25,39.26
  Inner2 w0.152: v1(24.38,38.74) v1(21.59,38.74)
  Bottom Layer w0.152: 45.21,36.07 44.07,37.21 25.78,37.21 24.38,38.61 v1(24.38,38.74)
PB8: length 13.4
  Top Layer w0.152: H2.21 5.16,30.31 8.89,34.04 8.89,37.21 10.47,38.79 U6.95
PB9: length 16.9
  Top Layer w0.152: H2.22 2.75,29.08 4.95,29.08 9.53,33.66 9.53,36.96 10.86,38.29 U6.96
PB10: length 42.7
  Top Layer w0.152: U6.47 27.24,46.79 v1(28.8,46.79)
  Inner2 w0.152: H1.19 61.73,32.85 60.5,31.62 54.36,31.62 37.52,48.46 30.48,48.46 v1(28.8,46.79)
PB11: length 43.1
  Top Layer w0.152: v1(25.4,47.29) U6.48
  Inner2 w0.152: H1.20 54.09,32.85 37.82,49.12 30.25,49.12 28.42,47.29 v1(25.4,47.29)
PB12: length 43.1
  Top Layer w0.152: v1(27.03,49.86) 25.7,49.86 U6.51
  Inner2 w0.152: v1(27.03,49.86) 29.72,49.86 29.97,49.61 38.2,49.61 53.7,34.11 60.47,34.11 H1.17
PB13: length 42
  Top Layer w0.152: v1(27.61,50.55) 27.13,51.03 25.55,51.03 25.19,50.66 U6.52
  Inner2 w0.152: v1(27.61,50.55) 28.3,50.55 28.91,51.16 37.49,51.16 45.87,42.77 49.38,42.77 56.76,35.39 H1.18
PB14: length 45.9
  Top Layer w0.152: U6.53 24.69,50.67 25.4,51.38 v1(27.61,51.38)
  Inner2 w0.152: v1(27.61,51.38) 28.93,52.71 36.75,52.71 46.13,43.33 49.58,43.33 56.29,36.63 60.44,36.63 H1.15
PB15: length 43.3
  Top Layer w0.152: v1(27.33,52.25) 26.82,51.74 25.25,51.74 24.19,50.68 U6.54
  Inner2 w0.152: H1.16 55.8,37.93 49.81,43.92 46.38,43.92 37.01,53.29 28.37,53.29 v1(27.33,52.25)
PC4: length 42.2
  Top Layer w0.152: U6.33 27.25,39.8 v1(29.92,39.8)
  Inner2 w0.152: H1.34 34.47,39.8 v1(29.92,39.8)
PC5: length 48.8
  Top Layer w0.152: U6.34 v1(25.4,40.29)
  Inner2 w0.152: H1.31 60.47,16.34 58.75,16.34 34.75,40.34 29.46,40.34 29.27,40.14 25.55,40.14 v1(25.4,40.29)
PC6: length 46.6
  Top Layer w0.152: U6.63 19.69,48.72 20.19,48.21 25.91,48.21 26.52,48.82 38.66,48.82 40.69,46.79 47.6,46.79 v1(48.18,46.2)
  Bottom Layer w0.152: v1(48.18,46.2) 48.87,46.2 52.04,49.38 60.49,49.38 H1.5
PC7: length 48.3
  Top Layer w0.152: U6.64 19.19,50.96 v1(19.81,51.59)
  Bottom Layer w0.152: v1(19.81,51.59) 19.81,53.09 22.99,56.26 29.72,56.26 31.88,58.42 36.83,58.42 43.31,51.94 57.89,51.94 H1.6
PC8: length 58.1
  Top Layer w0.152: U6.65 18.69,51.55 22.33,55.19 31.52,55.19 32.16,55.83 32.16,56.79 32.74,57.38 42.47,57.38 44.02,55.83 v1(45.11,55.83) ; CARD1.7 53.12,60.45 RN3.6 53.12,51.81 53.37,51.56 58.42,51.56 58.75,51.89 60.47,51.89 H1.3
  Inner2 w0.152: v1(45.11,55.83) v1(53.11,55.83)
PC9: length 56
  Top Layer w0.152: v1(45.11,56.72) 43.99,56.72 42.8,57.91 22.33,57.91 20.68,56.26 20.68,54.18 18.19,51.69 U6.66 ; H1.4 58.38,52.35 RN3.5 54.03,52.46 v1(54.03,56.66) 54.03,60.64
  Inner2 w0.152: v1(45.11,56.72) 53.97,56.72 v1(54.03,56.66)
PC10: length 67.6
  Top Layer w0.152: v1(46.33,60.64) 46.33,54.74 47.49,53.58 RN2.7 ; U6.78 7.4,47.29 H2.5
  Inner2 w0.152: H2.5 5.33,51.9 5.33,55.25 11.94,61.85 45.12,61.85 v1(46.33,60.64)
PC11: length 75.2
  Top Layer w0.152: v1(47.43,60.64) 47.43,54.78 48.29,53.92 RN2.6 ; H2.6 2.75,49.4 4.57,49.4 7.18,46.79 U6.79
  Inner2 w0.152: H2.6 2.79,51.9 2.79,56.64 8.64,62.48 45.58,62.48 v1(47.43,60.64)
PC12: length 74.5
  Top Layer w0.152: U6.80 6.34,46.29 4.54,48.09 H2.7 ; CARD1.5 v1(50.72,60.64) 50.72,57.79 51.52,56.99 51.52,52.35
  Inner2 w0.152: H2.7 5.46,49.49 5.46,50.55 6.1,51.18 6.1,54.99 12.57,61.47 16.64,61.47 17.47,60.64 31.94,60.64 32.64,61.34 44.45,61.34 46.23,59.56 50.04,59.56 50.72,60.25 v1(50.72,60.64)
PD0: length 11.6
  Top Layer w0.152: U6.81 5.77,45.79 4.7,46.86 2.75,46.86 H2.8
PD1: length 8.2
  Top Layer w0.152: U6.82 4.32,45.29 H2.9
PD2: length 81.8
  Top Layer w0.152: U6.83 6.18,44.79 5.59,44.2 2.88,44.2 H2.10 ; v1(48.53,60.64) 48.53,54.99 49.09,54.42 ; 49.09,54.42 49.1,54.43 ; 49.09,54.42 RN2.5
  Inner1 w0.152: v1(48.53,60.64) 47.06,62.1 7.37,62.1 5.72,60.45 5.72,47.88 4.57,46.74 2.79,46.74 1.61,45.55 H2.10
PD3: length 8.6
  Top Layer w0.152: U6.84 6.45,44.29 5.16,43.01 H2.11
PD4: length 12
  Top Layer w0.152: H2.12 2.75,41.78 4.95,41.78 6.96,43.79 U6.85
PD5: length 9.2
  Top Layer w0.152: U6.86 7.48,43.29 4.66,40.47 H2.13
PD6: length 12.6
  Top Layer w0.152: H2.14 2.75,39.24 4.57,39.24 8.12,42.79 U6.87
PD8: length 47.7
  Top Layer w0.152: v1(26.52,52.88) 25.71,52.07 25.07,52.07 23.69,50.69 U6.55
  Inner2 w0.152: H1.13 60.47,39.19 56.29,39.19 51.05,44.42 47.09,44.42 36.63,54.89 35.87,54.89 34.85,53.87 27.51,53.87 v1(26.52,52.88)
PD9: length 45
  Top Layer w0.152: U6.56 23.19,50.67 25.6,53.09 v1(25.65,53.09)
  Inner2 w0.152: v1(25.65,53.09) 27.03,54.46 34.62,54.46 35.59,55.42 36.93,55.42 41.2,51.16 42.32,51.16 48.39,45.09 51.38,45.09 56,40.47 H1.14
PD10: length 50
  Top Layer w0.152: v1(24.64,53.09) 24.64,52.63 22.69,50.68 U6.57
  Inner2 w0.152: H1.11 60.44,41.71 56.84,41.71 51.21,47.35 47.12,47.35 42.52,51.94 41.38,51.94 35.92,57.4 28.96,57.4 v1(24.64,53.09)
PD11: length 47.5
  Top Layer w0.152: v1(23.62,53.09) 23.62,52.12 22.19,50.68 U6.58
  Inner2 w0.152: H1.12 56.46,43.01 51.56,47.9 47.4,47.9 42.77,52.53 41.6,52.53 36.3,57.84 28.37,57.84 v1(23.62,53.09)
PD12: length 51.2
  Top Layer w0.152: v1(22.73,53.09) 22.73,51.77 21.69,50.72 U6.59
  Inner2 w0.152: v1(22.73,53.09) 27.94,58.29 36.63,58.29 41.78,53.14 43,53.14 47.62,48.51 51.77,48.51 56.01,44.27 60.47,44.27 H1.9
PD13: length 48.7
  Top Layer w0.152: v1(21.97,51.84) 21.19,51.06 U6.60
  Inner2 w0.152: H1.10 55.67,45.55 52.04,49.17 47.93,49.17 43.15,53.95 41.83,53.95 37.08,58.7 27.38,58.7 21.95,53.26 21.95,51.87 v1(21.97,51.84)
PD14: length 45.1
  Top Layer w0.152: v1(49.53,45.87) 48.21,47.19 40.89,47.19 38.89,49.2 26.34,49.2 25.86,48.72 20.9,48.72 20.69,48.94 U6.61
  Bottom Layer w0.152: H1.7 60.47,46.81 58.12,46.81 56.54,45.24 50.16,45.24 v1(49.53,45.87)
PD15: length 47.7
  Top Layer w0.152: v1(20.98,51.71) 20.19,50.92 U6.62
  Inner2 w0.152: v1(55.63,50.52) 56.77,50.52 H1.8
  Bottom Layer w0.152: v1(55.63,50.52) 43.46,50.52 36.37,57.61 32.36,57.61 30.2,55.45 23.14,55.45 20.98,53.29 v1(20.98,51.71)
PE0: length 14.2
  Top Layer w0.152: U6.97 10.99,37.79 10.03,36.83 10.03,33.4 4.4,27.77 H2.23
PE1: length 18.1
  Top Layer w0.152: U6.98 11.13,37.29 10.54,36.7 10.54,33.27 5.33,28.07 5.33,27.18 4.7,26.54 2.92,26.54 1.7,27.77 H2.24
PE2: length 14
  Top Layer w0.152: U6.1 12.77,34.74 5.84,27.81 5.84,27.01 H2.25
PE3: length 19.2
  Top Layer w0.152: U6.2 14.19,33.62 13.72,33.15 12.06,33.15 6.48,27.56 6.48,26.8 5.33,25.65 5.33,24.77 4.57,24 2.75,24 H2.26
PE4: length 17.3
  Top Layer w0.152: H2.27 5.84,24.47 5.84,25.4 6.98,26.54 6.98,27.19 12.43,32.64 13.84,32.64 14.69,33.48 U6.3
PE5: length 21.3
  Top Layer w0.152: U6.4 15.19,32.97 v1(14.73,32.51)
  Bottom Layer w0.152: v1(14.73,32.51) 5.33,23.11 5.33,22.1 4.7,21.46 2.75,21.46 H2.28
PE6: length 19.4
  Top Layer w0.152: U6.5 15.69,32.7 v1(15.49,32.51)
  Bottom Layer w0.152: v1(15.49,32.51) 5.84,22.86 5.84,21.93 H2.29
PE7: length 44.8
  Top Layer w0.152: U6.38 v1(25.4,42.29)
  Inner2 w0.152: v1(25.4,42.29) 25.65,42.04 35.18,42.04 57.07,20.15 H1.30
PE8: length 43.9
  Top Layer w0.152: v1(28.8,42.8) 27.24,42.8 U6.39
  Inner2 w0.152: H1.27 60.47,21.41 56.62,21.41 35.48,42.55 29.06,42.55 v1(28.8,42.8)
PE9: length 47.7
  Top Layer w0.152: U6.40 27.22,43.31 v1(23.75,43.31)
  Inner2 w0.152: H1.28 56.15,22.69 35.76,43.08 29.49,43.08 29.06,43.51 23.95,43.51 v1(23.75,43.31)
PE10: length 57.9
  Top Layer w0.152: v1(23.57,44.65) 24.23,43.99 24.87,43.99 25.15,43.71 v1(29.97,43.71)
  Inner2 w0.152: v1(23.57,44.65) 23.57,44.79 v1(16.17,52.2) ; H1.25 60.49,23.98 55.6,23.98 35.87,43.71 v1(29.97,43.71)
PE11: length 43
  Top Layer w0.152: U6.42 27.22,44.27 v1(25.81,44.27)
  Inner2 w0.152: H1.26 55.09,25.23 35.97,44.35 29.49,44.35 29.18,44.04 26.03,44.04 v1(25.81,44.27)
PE12: length 60.9
  Top Layer w0.152: 24.61,44.53 23.44,45.69 v1(23.44,45.85) ; 27.24,44.84 27.22,44.86 25.25,44.86 24.92,44.53 24.71,44.53 ; v1(28.8,44.78) 27.25,44.78 U6.43
  Inner2 w0.152: v1(23.44,45.85) 17.63,51.66 17.63,51.79 16.27,53.15 15.76,53.15 15.39,53.52 15.39,55.03 v1(16.12,55.75) ; H1.23 60.52,26.54 55.7,26.54 37.47,44.78 v1(28.8,44.78)
PE13: length 44.6
  Top Layer w0.152: v1(24.64,45.34) 24.69,45.29 U6.44
  Inner2 w0.152: v1(24.64,45.34) 24.84,45.54 28.98,45.54 29.34,45.19 37.92,45.19 55.34,27.77 H1.24
PE14: length 43.2
  Top Layer w0.152: U6.45 27.24,45.8 v1(29.84,45.8)
  Inner2 w0.152: v1(29.84,45.8) 31.32,47.27 36.83,47.27 55.07,29.03 60.47,29.03 H1.21
PE15: length 56.3
  Top Layer w0.152: U6.46 v1(25.4,46.29)
  Inner2 w0.152: v1(16.12,53.98) 23.8,46.29 v1(25.4,46.29) 25.78,45.91 28.97,45.91 30.91,47.85 37.19,47.85 54.73,30.31 H1.22
$1N1693: length 18
  Top Layer w0.152: X2.2 20.83,29.85 19.69,30.99 U6.13
  Bottom Layer w0.152: 30.86,21.72 29.72,22.86 29.72,23.88 v1(23.88,29.72)
  vias: v1(30.86,21.78)
$1N1695: length 13.8
  Top Layer w0.152: U6.12 19.18,34.73 19.18,33.91 15.11,29.85 X2.1 13.71,29.78 C4.1
$1N1697: length 32.6
  Top Layer w0.152: C5.2 21.46,13.27 21.46,15.49 23.35,17.38 v1(23.35,18.03) ; U6.9 17.69,36.54 v1(16.76,37.47)
  Inner2 w0.152: v1(16.76,26.42) v1(16.76,37.47)
  Bottom Layer w0.152: v1(23.35,18.03) 23.35,19.83 v1(16.76,26.42)
$1N1698: length 29.1
  Top Layer w0.152: C3.2 20.7,17.89 v1(20.85,18.03) ; U6.8 17.19,35.65 v1(16.13,36.7)
  Inner2 w0.152: v1(16.13,25.78) v1(16.13,36.7)
  Bottom Layer w0.152: v1(20.85,18.03) 20.85,21.06 v1(16.13,25.78)
$1N1844: length 32.5
  Top Layer w0.152: U6.21 23.69,33.77 v1(23.27,33.35)
  Bottom Layer w0.152: v1(42.23,12.33) 32.26,22.3 32.26,24.1 28.85,27.51 v1(27.31,27.51) 25.73,29.08 25.73,32.84 25.22,33.35 v1(23.27,33.35)
$1N1845: length 23.5
  Top Layer w0.152: C7.2 42.23,53.53 v1(43.43,54.74) ; U6.49 29.3,47.79 v1(30.99,46.1)
  Inner1 w0.152: v1(30.99,46.1) 32.38,47.5 36.19,47.5 v1(43.43,54.74)
$1N1846: length 11.5
  Top Layer w0.152: v1(10.41,53.21) 10.41,51.94 10.87,51.49 13.92,51.49 14.69,50.72 U6.73
  Inner2 w0.152: v1(9.51,49) 10.41,49.9 v1(10.41,53.21)
$1N3154: length 12.5
  Top Layer w0.254: USB1.7 37.47,55.28 37.47,54.65 arc(37.49,54.5) 37.58,54.38 37.61,54.34 arc(37.74,54.26) 37.88,54.23 38.07,54.23 arc(38.21,54.26) 38.34,54.34 38.36,54.36 arc(38.44,54.48) 38.47,54.63 USB1.5 38.47,56.25 37.9,56.82 v1(35.69,56.82)
  Bottom Layer w0.152: v1(33.68,51.9) 33.68,53.31 35.69,55.32 v1(35.69,56.82)
$1N3155: length 6.8
  Top Layer w0.254: v1(36.19,54.23) 36.7,54.23 36.97,54.5 USB1.8 36.97,55.86 arc(37,56.01) 37.08,56.13 37.1,56.15 arc(37.22,56.23) 37.37,56.26 37.57,56.26 arc(37.72,56.23) 37.84,56.15 37.86,56.13 arc(37.94,56) 37.97,55.86 37.97,55.29 USB1.6
  Bottom Layer w0.152: v1(35.56,51.93) 36.19,52.56 v1(36.19,54.23)
$1N3177: length 14.4
  Inner2 w0.152: v1(27.28,22.48) 28.96,22.48 32.13,19.3 34.54,19.3 37,16.85 v1(39.37,16.85)
$1N3189: length 8.8
  Bottom Layer w0.152: P1.8 28.07,3.43 29.21,4.57 29.21,8 v1(26.67,10.54)
$1N3192: length 6.1
  Top Layer w0.152: LED5.1 48.89,5.74 R18.2
$1N3201: length 8.4
  Bottom Layer w0.152: v1(24.89,10.55) 26.67,8.77 26.67,4.7 P1.10
$1N5487: length 2.4
  Top Layer w0.152: LED4.3 R3.2
$1N5507: length 2.5
  Top Layer w0.152: R7.2 14.44,55.58 LED4.1
$1N5508: length 2.5
  Top Layer w0.152: R2.2 14.44,52.38 LED4.5
$1N15506: length 22.8
  Top Layer w0.152: 33.35,39.37 33.35,27.93 C22.2
  Top Layer w0.355: OLED1.2 33.35,39.37
$1N15507: length 21.1
  Top Layer w0.152: 34.05,39.37 34.05,28.63 C22.1
  Top Layer w0.355: OLED1.3 34.05,39.37
$1N15508: length 23.4
  Top Layer w0.152: 34.75,39.35 34.75,29.32 C23.2
  Top Layer w0.355: OLED1.4 34.75,39.35
$1N15509: length 21.7
  Top Layer w0.152: C23.1 35.45,30.02 35.45,39.36
  Top Layer w0.355: OLED1.5 35.45,39.36
$1N15524: length 26
  Top Layer w0.152: 51.55,39.18 51.55,37.45 v1(51.87,37.14)
  Top Layer w0.355: OLED1.28 51.55,39.18
  Bottom Layer w0.152: v1(51.87,37.14) 51.82,37.14 37.86,23.18 v1(36.7,23.18)
$1N15525: length 27.3
  Top Layer w0.152: 50.85,39.19 50.85,38.2 v1(50.72,38.07)
  Top Layer w0.355: OLED1.27 50.85,39.19
  Bottom Layer w0.152: v1(50.72,38.07) 35.83,23.18 v1(33.66,23.18)
$1N15526: length 43.2
  Top Layer w0.152: v1(33.05,26.09) 25.73,26.09 23.82,24.18 23.82,20.62 R25.2 ; 50.15,39.26 50.15,38.8 v1(50.09,38.74)
  Top Layer w0.355: OLED1.26 50.15,39.26
  Bottom Layer w0.152: v1(33.05,26.09) 37.44,26.09 v1(50.09,38.74)
$1N15542: length 52.4
  Top Layer w0.152: OLED1.15 42.45,44.2 43.05,44.81 53.85,44.81 56.11,42.55 56.11,14.06 R22.1 v1(52.45,12.95)
  Top Layer w0.355: OLED1.15 42.45,39.27 42.44,39.27
$1N15550: length 29.3
  Top Layer w0.152: v1(44.96,18.48) 47.19,18.48 R24.1 ; v1(45.75,24.87) 45.05,24.17 D2.2 41.75,27.38 41.75,39.27
  Top Layer w0.355: OLED1.14 41.75,39.27
  Inner1 w0.152: v1(45.75,24.87) 44.96,24.08 v1(44.96,18.48)
$1N15594: length 12.5
  Top Layer w1.016: F1.1 17.69,4.32 U7.4 14.06,6.95 U7.3

## Copper pours and planes (outline as drawn; the poured copper is in the pictures)
GND on Top Layer: -10.26,72.7 73.94,72.7 73.94,-8.71 -10.26,-8.71
GND on Bottom Layer: -14.94,77.17 79.3,77.17 79.3,-13.77 -14.94,-13.77
GND on Inner1: -5.44,67.01 69.88,67.01 69.88,-3.1 -5.44,-3.1
GND on Inner2: -18.95,81.92 83.67,81.92 83.67,-17.02 -18.95,-17.02

Small or netless copper shapes (teardrops, artwork), in the pictures only: 432 on Top Layer, 83 on Bottom Layer, 31 on Inner1, 100 on Inner2
